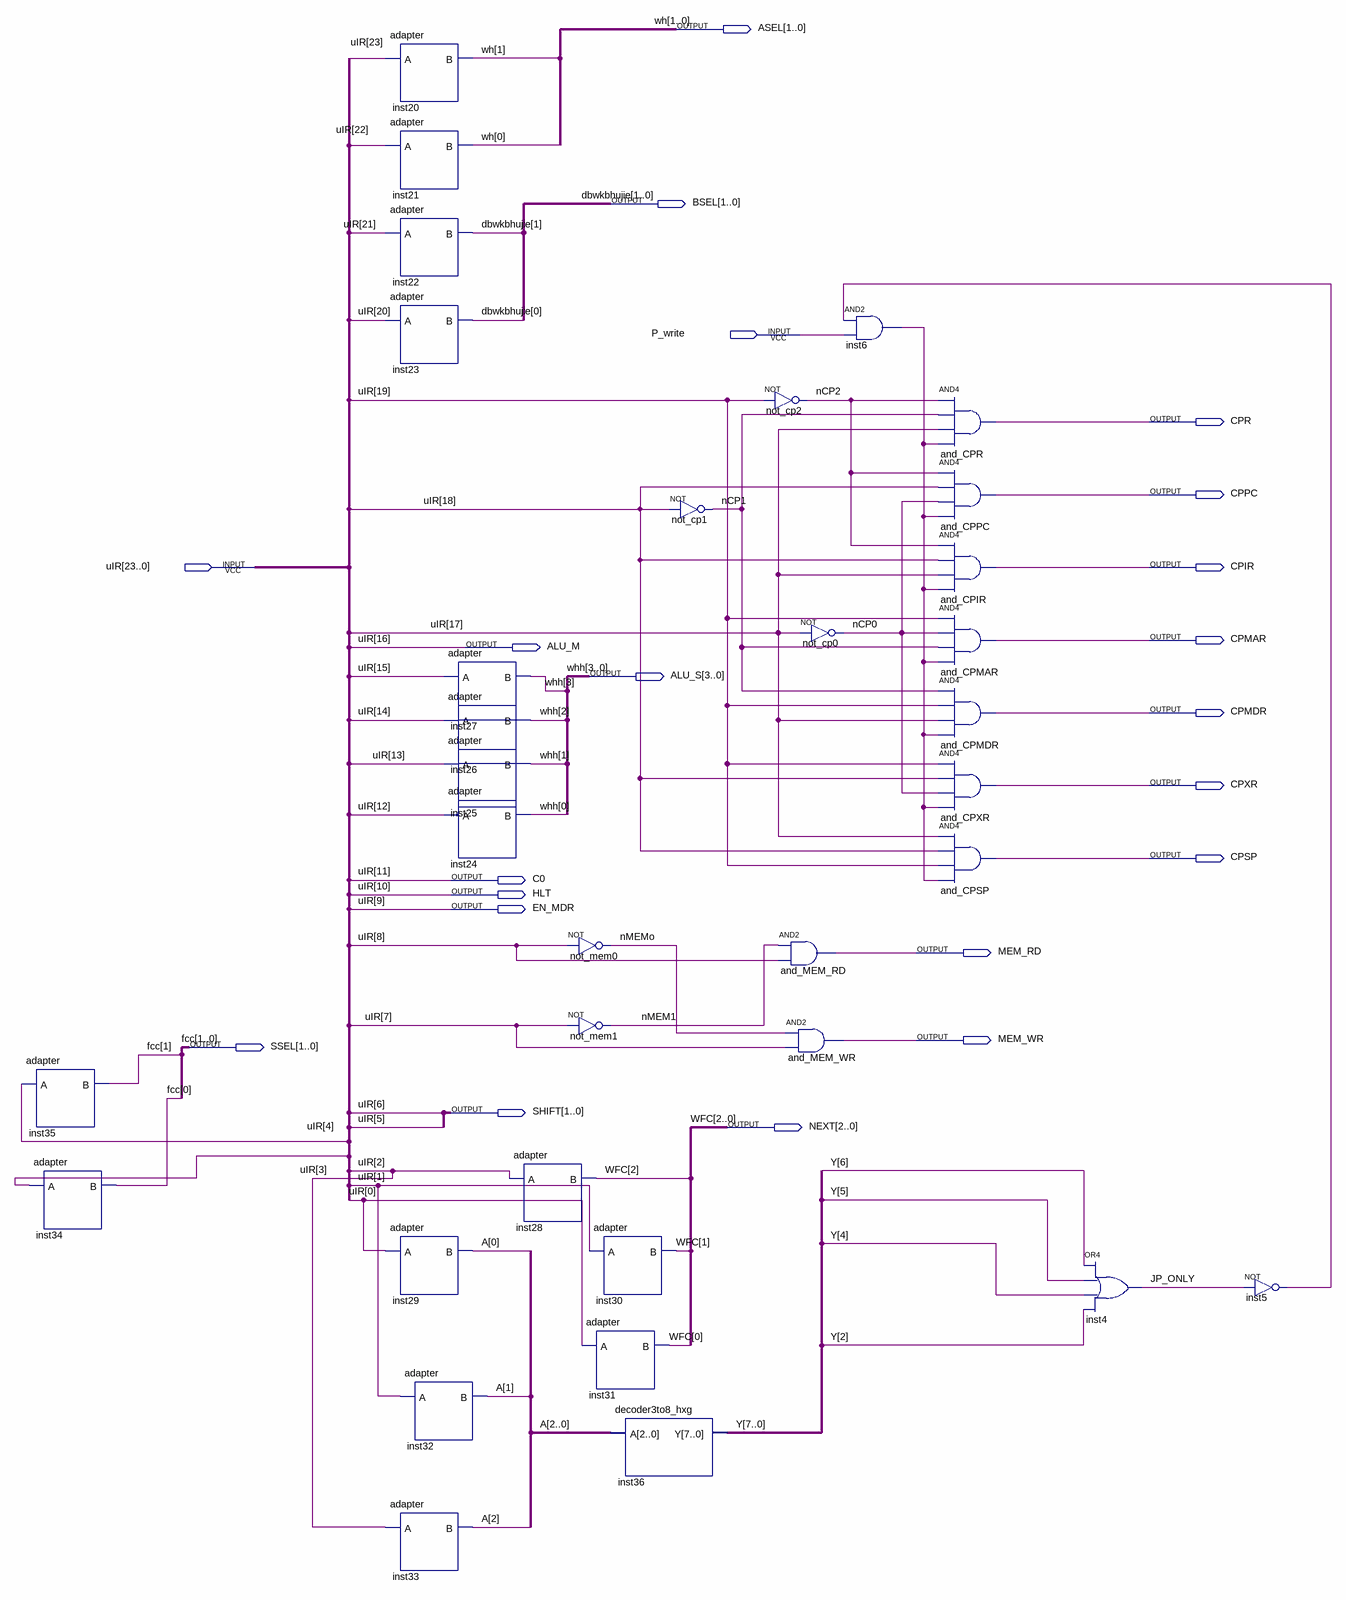
[diagram p0: schematic sheet]
// Quartus schematic controlDecode_hxgdly.bdf as structural Verilog: 34 symbols, 21 pins
module controlDecode_hxgdly (
  input  P_write,
  input  [23:0] uIR,
  output [1:0] ASEL,
  output [1:0] BSEL,
  output CPR,
  output CPPC,
  output CPIR,
  output CPMAR,
  output ALU_M,
  output [3:0] ALU_S,
  output CPMDR,
  output CPXR,
  output CPSP,
  output C0,
  output HLT,
  output EN_MDR,
  output MEM_RD,
  output MEM_WR,
  output [1:0] SSEL,
  output [1:0] SHIFT,
  output [2:0] NEXT
);

  wire inst5_out, inst6_out, JP_ONLY, nCP0, nCP1, nCP2, nMEM1, nMEMo;
  wire [2:0] A;
  wire [7:0] Y;

  adapter inst35 (.A(uIR[4]), .B(SSEL[1]));
  adapter inst34 (.A(uIR[3]), .B(SSEL[0]));
  adapter inst20 (.A(uIR[23]), .B(ASEL[1]));
  adapter inst21 (.A(uIR[22]), .B(ASEL[0]));
  adapter inst22 (.A(uIR[21]), .B(BSEL[1]));
  adapter inst23 (.A(uIR[20]), .B(BSEL[0]));
  adapter inst29 (.A(uIR[0]), .B(A[0]));
  adapter inst32 (.A(uIR[1]), .B(A[1]));
  adapter inst33 (.A(uIR[2]), .B(A[2]));
  adapter inst27 (.A(uIR[15]), .B(ALU_S[3]));
  adapter inst26 (.A(uIR[14]), .B(ALU_S[2]));
  adapter inst25 (.A(uIR[13]), .B(ALU_S[1]));
  adapter inst24 (.A(uIR[12]), .B(ALU_S[0]));
  adapter inst28 (.A(uIR[2]), .B(NEXT[2]));
  not not_mem0 (nMEMo, uIR[8]);
  not not_mem1 (nMEM1, uIR[7]);
  adapter inst30 (.A(uIR[1]), .B(NEXT[1]));
  adapter inst31 (.A(uIR[0]), .B(NEXT[0]));
  decoder3to8_hxg inst36 (.A(A), .Y(Y));
  not not_cp1 (nCP1, uIR[18]);
  not not_cp2 (nCP2, uIR[19]);
  not not_cp0 (nCP0, uIR[17]);
  and and_MEM_RD (MEM_RD, nMEM1, uIR[8]);
  and and_MEM_WR (MEM_WR, nMEMo, uIR[7]);
  and inst6 (inst6_out, inst5_out, P_write);
  and and_CPR (CPR, nCP2, nCP1, uIR[17], inst6_out);
  and and_CPPC (CPPC, nCP2, uIR[18], nCP0, inst6_out);
  and and_CPIR (CPIR, nCP2, uIR[18], uIR[17], inst6_out);
  and and_CPMAR (CPMAR, uIR[19], nCP0, nCP1, inst6_out);
  and and_CPMDR (CPMDR, nCP1, uIR[19], uIR[17], inst6_out);
  and and_CPXR (CPXR, uIR[19], uIR[18], nCP0, inst6_out);
  and and_CPSP (CPSP, uIR[17], uIR[18], uIR[19], inst6_out);
  or inst4 (JP_ONLY, Y[6], Y[5], Y[4], Y[2]);
  not inst5 (inst5_out, JP_ONLY);

  assign ALU_M = uIR[16];
  assign C0 = uIR[11];
  assign EN_MDR = uIR[9];
  assign HLT = uIR[10];

  // Other names for the same wires on the sheet: dbwkbhujie[1:0] = BSEL; fcc[1:0] = SSEL; WFC[2:0] = NEXT;
  //   wh[1:0] = ASEL; whh[3:0] = ALU_S
endmodule
